# EAGLE design adapter (EAGLE 9.6.2)
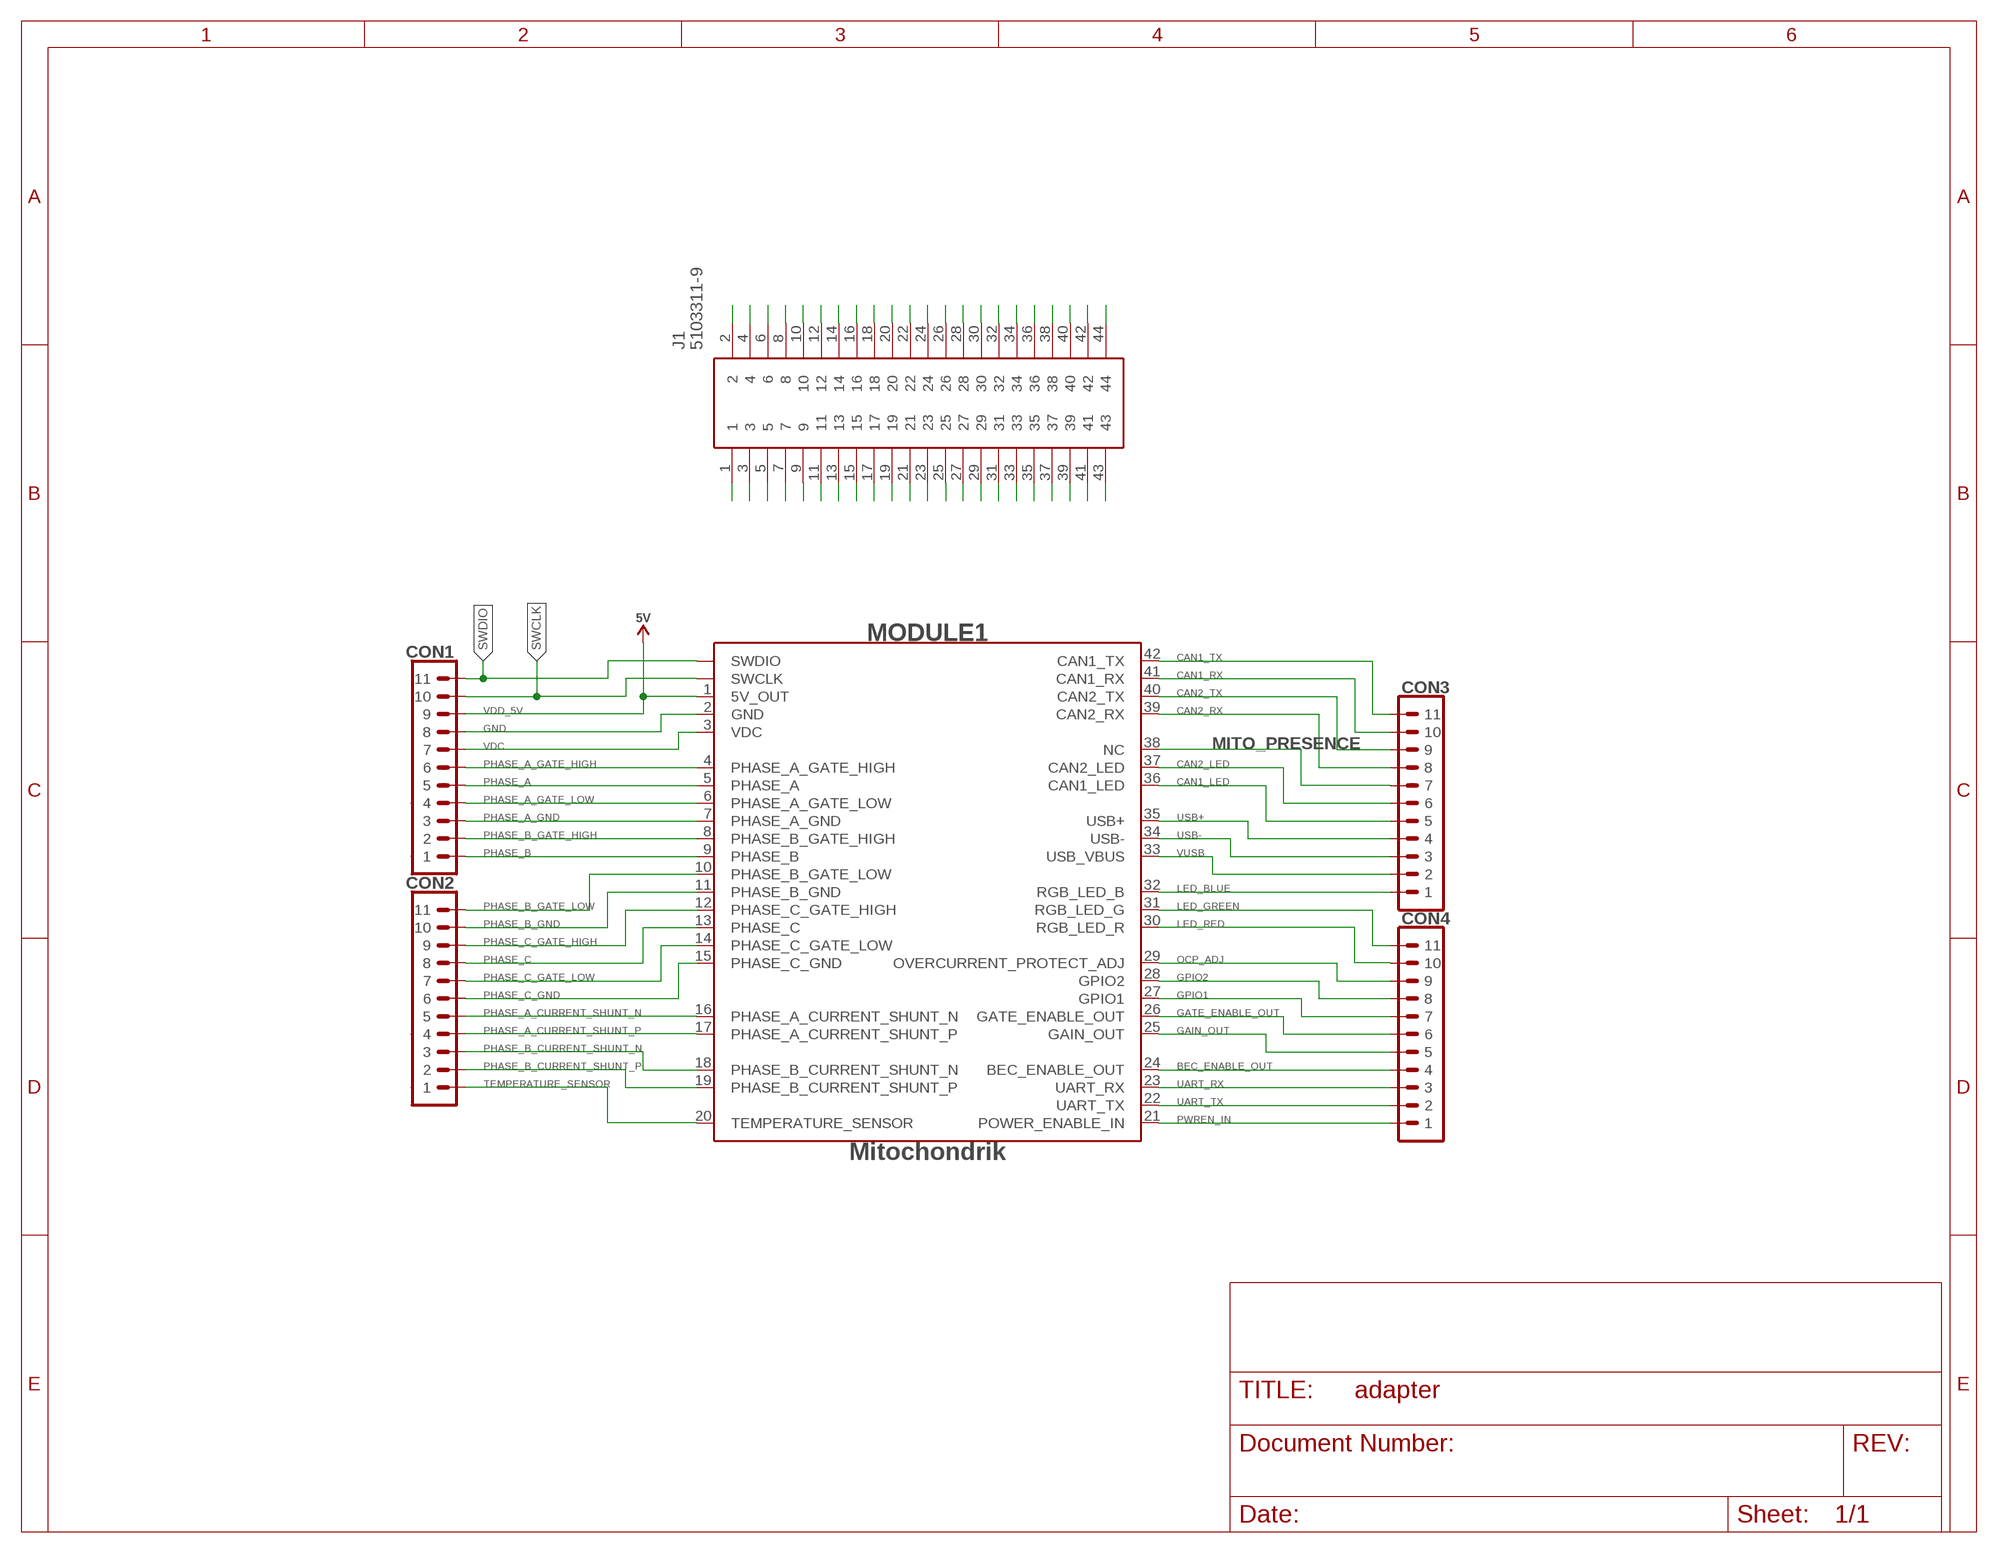
[diagram p0: schematic, sheet 1]

## Parts
CON1  PINHEAD_1X11-2.54_STRAIGHT_FEMALE  [1X11-PTH-2.54-FEMALE]
CON2  PINHEAD_1X11-2.54_STRAIGHT_FEMALE  [1X11-PTH-2.54-FEMALE]
CON3  PINHEAD_1X11-2.54_STRAIGHT_FEMALE  [1X11-PTH-2.54-FEMALE]
CON4  PINHEAD_1X11-2.54_STRAIGHT_FEMALE  [1X11-PTH-2.54-FEMALE]
J1  5103311-9  [SHDRRA44W66P254_2X22_6337X986X]
MODULE1  MITOHONDRIQUE_POGO-POGO  [MITOHONDRIQUE-POGO]

## Nets
BEC_ENABLE_OUT: CON4.4 J1.37 MODULE1.24(BEC_ENABLE_OUT)
CAN1_LED: CON3.5 J1.13 MODULE1.36(CAN1_LED)
CAN1_RX: CON3.10 J1.3 MODULE1.41(CAN1_RX)
CAN1_TX: CON3.11 J1.1 MODULE1.42(CAN1_TX)
CAN2_LED: CON3.6 J1.11 MODULE1.37(CAN2_LED)
CAN2_RX: CON3.8 J1.7 MODULE1.39(CAN2_RX)
CAN2_TX: CON3.9 J1.5 MODULE1.40(CAN2_TX)
GAIN_OUT: CON4.5 J1.35 MODULE1.25(GAIN_OUT)
GATE_ENABLE_OUT: CON4.6 J1.33 MODULE1.26(GATE_ENABLE_OUT)
GND: CON1.8 J1.8 MODULE1.2(GND)
GPIO1: CON4.7 J1.31 MODULE1.27(GPIO1)
GPIO2: CON4.8 J1.29 MODULE1.28(GPIO2)
LED_BLUE: CON3.1 J1.21 MODULE1.32(RGB_LED_B)
LED_GREEN: CON4.11 J1.23 MODULE1.31(RGB_LED_G)
LED_RED: CON4.10 J1.25 MODULE1.30(RGB_LED_R)
MITO_PRESENCE: CON3.7 J1.9 MODULE1.38(NC)
OCP_ADJ: CON4.9 J1.27 MODULE1.29(OVERCURRENT_PROTECT_ADJ)
PHASE_A: CON1.5 J1.14 MODULE1.5(PHASE_A)
PHASE_A_CURRENT_SHUNT_N: CON2.5 J1.36 MODULE1.16(PHASE_A_CURRENT_SHUNT_N)
PHASE_A_CURRENT_SHUNT_P: CON2.4 J1.38 MODULE1.17(PHASE_A_CURRENT_SHUNT_P)
PHASE_A_GATE_HIGH: CON1.6 J1.12 MODULE1.4(PHASE_A_GATE_HIGH)
PHASE_A_GATE_LOW: CON1.4 J1.16 MODULE1.6(PHASE_A_GATE_LOW)
PHASE_A_GND: CON1.3 J1.18 MODULE1.7(PHASE_A_GND)
PHASE_B: CON1.1 J1.22 MODULE1.9(PHASE_B)
PHASE_B_CURRENT_SHUNT_N: CON2.3 J1.40 MODULE1.18(PHASE_B_CURRENT_SHUNT_N)
PHASE_B_CURRENT_SHUNT_P: CON2.2 J1.42 MODULE1.19(PHASE_B_CURRENT_SHUNT_P)
PHASE_B_GATE_HIGH: CON1.2 J1.20 MODULE1.8(PHASE_B_GATE_HIGH)
PHASE_B_GATE_LOW: CON2.11 J1.24 MODULE1.10(PHASE_B_GATE_LOW)
PHASE_B_GND: CON2.10 J1.26 MODULE1.11(PHASE_B_GND)
PHASE_C: CON2.8 J1.30 MODULE1.13(PHASE_C)
PHASE_C_GATE_HIGH: CON2.9 J1.28 MODULE1.12(PHASE_C_GATE_HIGH)
PHASE_C_GATE_LOW: CON2.7 J1.32 MODULE1.14(PHASE_C_GATE_LOW)
PHASE_C_GND: CON2.6 J1.34 MODULE1.15(PHASE_C_GND)
PWREN_IN: CON4.1 J1.43 MODULE1.21(POWER_ENABLE_IN)
SWCLK: CON1.10 J1.4 MODULE1.SWCLK
SWDIO: CON1.11 J1.2 MODULE1.SWDIO
TEMPERATURE_SENSOR: CON2.1 J1.44 MODULE1.20(TEMPERATURE_SENSOR)
UART_RX: CON4.3 J1.39 MODULE1.23(UART_RX)
UART_TX: CON4.2 J1.41 MODULE1.22(UART_TX)
USB+: CON3.4 J1.15 MODULE1.35(USB+)
USB-: CON3.3 J1.17 MODULE1.34(USB-)
VDC: CON1.7 J1.10 MODULE1.3(VDC)
VDD_5V: CON1.9 J1.6 MODULE1.1(5V_OUT) ; supply symbol labelled 5V
VUSB: CON3.2 J1.19 MODULE1.33(USB_VBUS)

## Library data of the parts
CON1-CON4 = pinhead:PINHEAD_1X11; DIGIKEY#: S7009-ND; MANF: Sullins Connector Solutions; MANF#: PPTC111LFBN-RC
J1 = 5103311-9:5103311-9: A/L LOW PRO HDR 44P RA BLACK Source: Datasheet <https://componentsearchengine.com/Datasheets/1/5103311-9.pdf>; ALTERNATIVE: 1-5102153-3 for top; DESCRIPTION: A/L LOW PRO HDR 44P RA BLACK; HEIGHT: 9.271mm; MANF: TE Connectivity; MANF#: 5103311-9; MOUSER_PART_NUMBER: 571-5103311-9; MOUSER_PRICE-STOCK: https://www.mouser.com/Search/Refine.aspx?Keyword=571-5103311-9
MODULE1 = mito-pogo:MITOHONDRIQUE_POGO; MANF: Zubax Robotics; MANF#: Mitochondrik

## Net classes
1 VDC: width 0.3 mm, clearance 0.3 mm
2 5V: width 0.5 mm

## Board
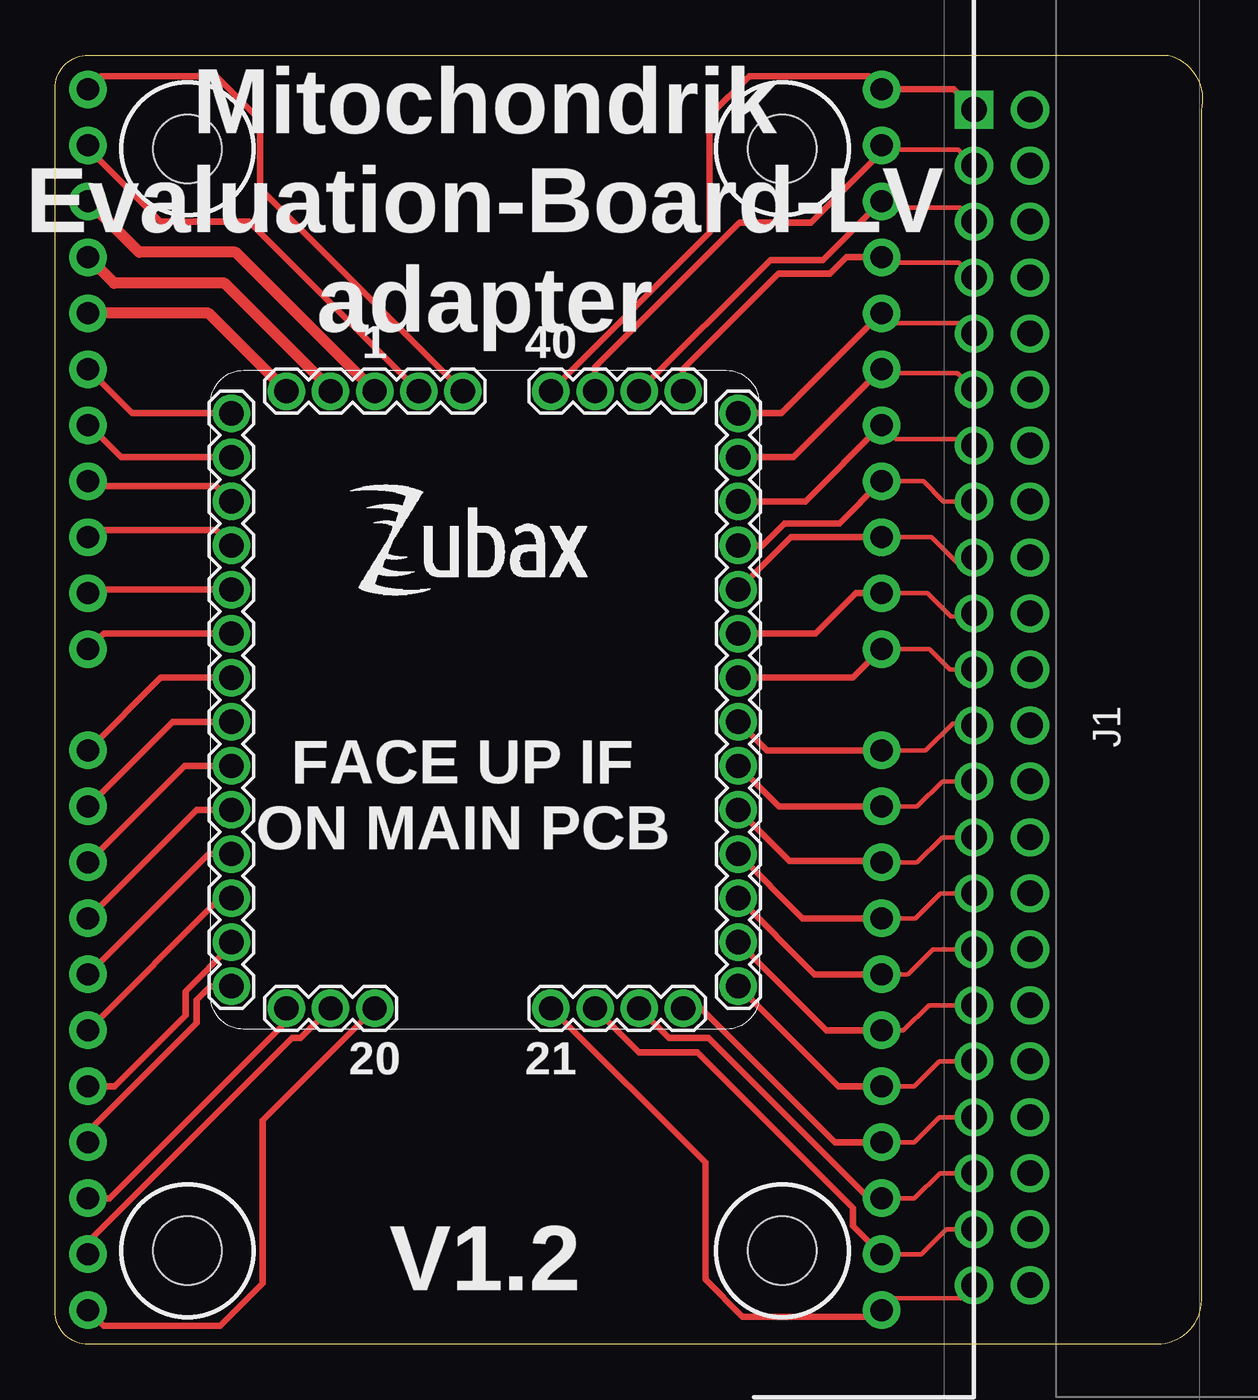
[diagram p1: board, top side]
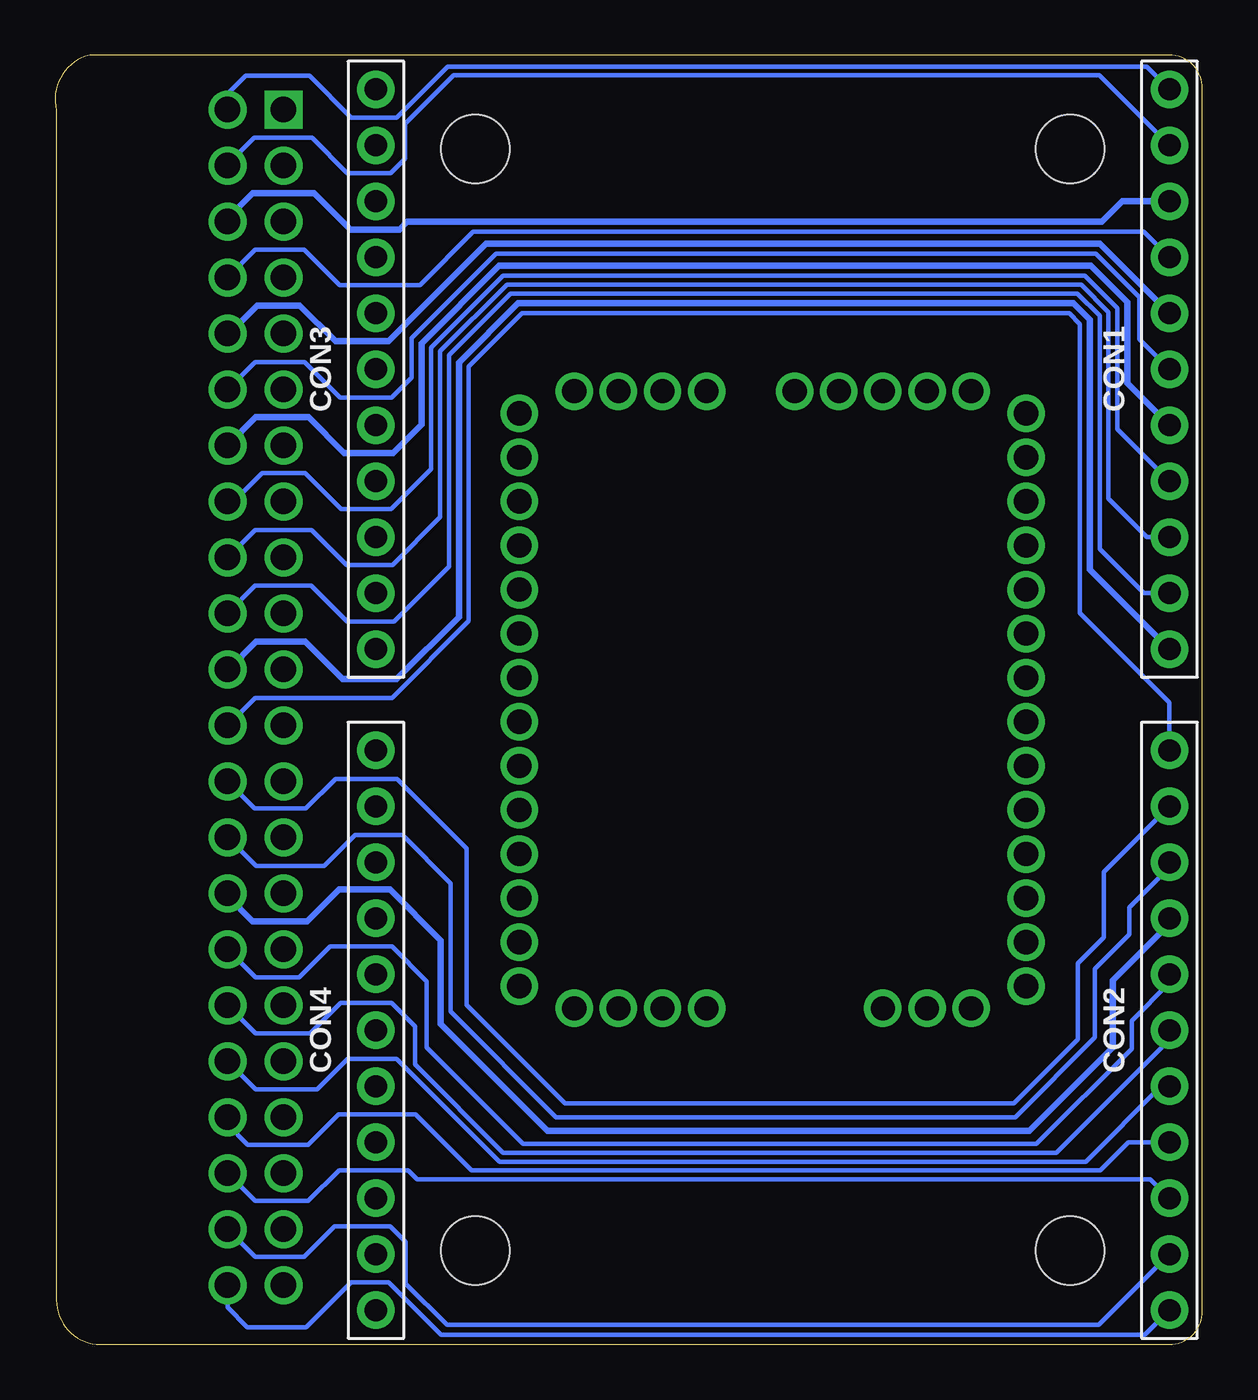
[diagram p2: board, bottom side, seen from below]

Size 52.06 x 58.5 mm. Coordinates in mm from the lower left corner, seen from the top.
Outline: 1.5,58.5 50.5,58.5 arc-90 52,56 52,2 arc-90 50,0 1.5,0 arc-90 0,1.5 0,57 arc-90 1.5,58.5
Copper layers (1*16): Top 0.035mm / dielectric 1.5mm / Bottom 0.035mm
Design rules "myxa *": minimum track width 0.15mm, minimum drill 0.2mm, track to track 0.2mm, track to pad 0.2mm, pad to pad 0.2mm, via to via 0.2mm, smd to smd 0.15mm, copper to edge 0.3mm, drill to drill 0.2mm, minimum pad ring 0.125mm, minimum via ring 0.125mm, stop-mask expansion 1mil, vias tented up to drill 0.51mm, thermal gap 8mil
Holes 3.1 mm at 6,4.25 33,4.25 6,54.25 33,54.25

### Footprints (pad centres in the part's own frame; a part is rotated, then mirrored left to right if it is on the bottom)
1X11-PTH-2.54-FEMALE = drill 1.016 pad 1.7: 1 -12.7,0; 2 -10.16,0; 3 -7.62,0; 4 -5.08,0; 5 -2.54,0; 6 0,0; 7 2.54,0; 8 5.08,0; 9 7.62,0; 10 10.16,0; 11 12.7,0
SHDRRA44W66P254_2X22_6337X986X = drill 1.15 pad 1.725 square: 1 0,0 | drill 1.15 pad 1.725: 2 0,2.54; 3 2.54,0; 4 2.54,2.54; 5 5.08,0; 6 5.08,2.54; 7 7.62,0; 8 7.62,2.54; 9 10.16,0; 10 10.16,2.54; 11 12.7,0; 12 12.7,2.54; 13 15.24,0; 14 15.24,2.54; 15 17.78,0; 16 17.78,2.54; 17 20.32,0; 18 20.32,2.54; 19 22.86,0; 20 22.86,2.54; 21 25.4,0; 22 25.4,2.54; 23 27.94,0; 24 27.94,2.54; 25 30.48,0; 26 30.48,2.54; 27 33.02,0; 28 33.02,2.54; 29 35.56,0; 30 35.56,2.54; 31 38.1,0; 32 38.1,2.54; 33 40.64,0; 34 40.64,2.54; 35 43.18,0; 36 43.18,2.54; 37 45.72,0; 38 45.72,2.54; 39 48.26,0; 40 48.26,2.54; 41 50.8,0; 42 50.8,2.54; 43 53.34,0; 44 53.34,2.54
MITOHONDRIQUE-POGO = drill 1.1 pad 1.7: 1 -5,14; 2 -7,14; 3 -9,14; 4 -11.5,13; 5 -11.5,11; 6 -11.5,9; 7 -11.5,7; 8 -11.5,5; 9 -11.5,3; 10 -11.5,1; 11 -11.5,-1; 12 -11.5,-3; 13 -11.5,-5; 14 -11.5,-7; 15 -11.5,-9; 16 -11.5,-11; 17 -11.5,-13; 18 -9,-14; 19 -7,-14; 20 -5,-14; 21 3,-14; 22 5,-14; 23 7,-14; 24 9,-14; 25 11.5,-13; 26 11.5,-11; 27 11.5,-9; 28 11.5,-7; 29 11.5,-5; 30 11.5,-3; 31 11.5,-1; 32 11.5,1; 33 11.5,3; 34 11.5,5; 35 11.5,7; 36 11.5,9; 37 11.5,11; 38 11.5,13; 39 9,14; 40 7,14; 41 5,14; 42 3,14; SWCLK -3,14; SWDIO -1,14

### Placement (x,y rotation side)
CON1  1.5,44.25 90 bottom
CON2  1.5,14.25 90 bottom
CON3  37.5,44.25 90 bottom
CON4  37.5,14.25 90 bottom
J1  41.7,56.03 270 top
MODULE1  19.5,29.25 0 top
U$2  [ZUBAX_LOGO_5X10]  13.3,33.8 0 top

### Tracks (layer width: path | path; a pad name or v marks a point on that pad's centre or on a via)
BEC_ENABLE_OUT
  Top 0.2: CON4.4 38.99,9.17 40.13,10.31 J1.37
  Top 0.3: CON4.4 35.38,9.17 29.3,15.25 MODULE1.24
CAN1_LED
  Top 0.2: CON3.5 38.14,41.07 41.42,41.07 J1.13
  Top 0.3: MODULE1.36 34.04,38.25 CON3.5
CAN1_RX
  Top 0.2: CON3.10 37.71,54.2 40.99,54.2 J1.3
  Top 0.3: MODULE1.41 24.5,44.35 31.05,50.9 34.3,50.9 37.5,54.1 CON3.10
CAN1_TX
  Top 0.3: CON3.11 36.9,57.55 31.5,57.55 29.7,55.75 29.7,50.45 MODULE1.42
  Top 0.305: CON3.11 40.78,56.95 J1.1
CAN2_LED
  Top 0.2: CON3.6 37.67,44.08 40.95,44.08 J1.11
  Top 0.3: MODULE1.37 33.5,40.25 CON3.6
CAN2_RX
  Top 0.2: CON3.8 37.74,49.09 41.02,49.09 J1.7
  Top 0.3: CON3.8 35.9,49.33 35.15,48.58 32.83,48.58 28.5,44.25 MODULE1.39
CAN2_TX
  Top 0.2: CON3.9 37.79,51.58 41.07,51.58 J1.5
  Top 0.3: CON3.9 34.83,49.2 32.45,49.2 MODULE1.40
GAIN_OUT
  Top 0.2: CON4.5 38.98,11.71 40.12,12.85 J1.35
  Top 0.3: MODULE1.25 35.54,11.71 CON4.5
GATE_ENABLE_OUT
  Top 0.2: CON4.6 38.5,14.25 39.64,15.39 J1.33
  Top 0.3: CON4.6 35,14.25 MODULE1.26
GND
  Top 0.5: MODULE1.2 12.5,43.35 7.7,48.15 2.68,48.15 CON1.8
  Bottom 0.2: CON1.8 2.66,50.49 33.09,50.49 35.51,48.07 39.15,48.07 40.75,49.67 42.98,49.67 J1.8
GPIO1
  Top 0.2: CON4.7 38.7,16.79 39.84,17.93 J1.31
  Top 0.3: CON4.7 34.46,16.79 MODULE1.27
GPIO2
  Top 0.2: CON4.8 39.03,19.33 40.17,20.47 J1.29
  Top 0.3: CON4.8 33.92,19.33 MODULE1.28
LED_BLUE
  Top 0.2: CON3.1 39.68,31.55 40.6,30.63 J1.21
  Top 0.3: CON3.1 36.2,30.25 MODULE1.32
LED_GREEN
  Top 0.2: CON4.11 39.5,26.95 40.73,28.18 41.61,28.18 J1.23
  Top 0.3: MODULE1.31 32.3,26.95 CON4.11
LED_RED
  Top 0.2: CON4.10 39.11,24.41 40.25,25.55 J1.25
  Top 0.3: MODULE1.30 32.84,24.41 CON4.10
MITO_PRESENCE
  Top 0.2: CON3.7 37.96,46.33 41.24,46.33 J1.9
  Top 0.3: CON3.7 32.96,42.25 MODULE1.38
OCP_ADJ
  Top 0.2: CON4.9 39.11,21.87 40.25,23.01 J1.27
  Top 0.3: MODULE1.29 33.33,21.93 37.45,21.93 CON4.9
PHASE_A
  Top 0.3: MODULE1.5 3,40.25 1.54,41.71 CON1.5
  Bottom 0.3: CON1.5 3.41,43.62 3.41,47.29 5.06,48.94 31.91,48.94 35.44,45.41 35.44,41.74 36.73,40.45 38.94,40.45 40.56,42.07 42.96,42.07 J1.14
PHASE_A_CURRENT_SHUNT_N
  Top 0.3: MODULE1.16 8,18.1 5.93,16.02 5.93,14.92 2.71,11.71 CON2.5
  Bottom 0.2: CON2.5 1.88,11.71 5.3,8.29 31.89,8.29 36.56,12.96 38.78,12.96 40.17,11.57 42.96,11.57 J1.36
PHASE_A_CURRENT_SHUNT_P
  Top 0.3: MODULE1.17 7.05,16.25 6.43,15.63 6.43,14.6 1.5,9.67 CON2.4
  Bottom 0.2: CON2.4 3.36,9.17 4.64,7.89 33.16,7.89 35.71,10.44 39.19,10.44 40.58,9.05 43.31,9.05 44.24,9.98 J1.38
PHASE_A_GATE_HIGH
  Top 0.3: MODULE1.4 3.5,42.25 CON1.6
  Bottom 0.2: CON1.6 2.86,45.61 2.86,47.51 4.83,49.49 32.06,49.49 35.89,45.65 35.89,43.87 36.79,42.97 39.13,42.97 40.74,44.58 42.99,44.58 J1.12
PHASE_A_GATE_LOW
  Top 0.3: MODULE1.6 7.3,38.95 1.72,38.95 CON1.4
  Bottom 0.2: CON1.4 3.86,41.53 3.86,47.01 5.34,48.49 31.73,48.49 34.99,45.22 34.99,39.72 36.81,37.9 39.08,37.9 40.72,39.54 42.67,39.54 43.96,38.25 J1.16
PHASE_A_GND
  Top 0.3: MODULE1.7 7.3,36.95 1.82,36.95 CON1.3
  Bottom 0.2: CON1.3 2.52,36.63 4.26,38.37 4.26,46.84 5.51,48.09 31.56,48.09 34.59,45.06 34.59,37.53 36.75,35.37 38.84,35.37 40.43,36.96 42.99,36.96 J1.18
PHASE_B
  Top 0.3: CON1.1 2.2,32.25 MODULE1.9
  Bottom 0.3: CON1.1 5.11,35.16 5.11,46.49 5.86,47.24 31.05,47.24 33.74,44.55 33.74,33 36.56,30.18 39.01,30.18 40.71,31.88 42.94,31.88 44.19,30.63 J1.22
PHASE_B_CURRENT_SHUNT_N
  Top 0.3: MODULE1.18 10.5,14.65 2.48,6.63 CON2.3
  Bottom 0.2: CON2.3 2.36,7.49 35.64,7.49 36.05,7.9 39.18,7.9 40.57,6.51 42.98,6.51 J1.40
PHASE_B_CURRENT_SHUNT_P
  Top 0.3: MODULE1.19 11.15,13.9 10.75,13.9 1.5,4.65 CON2.2
  Bottom 0.2: CON2.2 4.71,0.88 34.28,0.88 36.16,2.76 36.16,4.65 36.87,5.36 39.38,5.36 40.76,3.98 42.99,3.98 J1.42
PHASE_B_GATE_HIGH
  Top 0.3: MODULE1.8 1.66,34.25 CON1.2
  Bottom 0.2: CON1.2 2.65,34.09 4.66,36.1 4.66,46.68 5.67,47.69 31.39,47.69 34.19,44.89 34.19,35.29 36.67,32.81 38.82,32.81 40.44,34.43 42.98,34.43 J1.20
PHASE_B_GATE_LOW
  Top 0.3: MODULE1.10 4.8,30.25 CON2.11
  Bottom 0.2: CON2.11 1.5,29.12 5.56,33.18 5.56,46.3 6.04,46.79 30.87,46.79 33.29,44.36 33.29,32.81 36.76,29.34 42.99,29.34 J1.24
PHASE_B_GND
  Top 0.3: MODULE1.11 5.34,28.25 CON2.10
  Bottom 0.2: CON2.10 4.47,21.44 4.47,18.47 5.65,17.29 5.65,13.84 8.55,10.94 28.92,10.94 33.39,15.41 33.39,22.51 36.54,25.66 39.33,25.66 40.68,24.31 43,24.31 J1.26
PHASE_C
  Top 0.3: MODULE1.13 6.42,24.25 CON2.8
  Bottom 0.3: CON2.8 1.5,19.08 4.07,16.51 4.07,13.48 7.86,9.69 29.71,9.69 34.57,14.55 34.57,18.34 36.87,20.64 39.18,20.64 40.62,19.2 43.1,19.2 44.24,20.34 J1.30
PHASE_C_GATE_HIGH
  Top 0.3: MODULE1.12 5.88,26.25 CON2.9
  Bottom 0.2: J1.28 42.94,21.71 39.85,21.71 38.45,23.11 36.3,23.11 34.12,20.93 34.12,15.11 29.32,10.31 8.49,10.31 4.88,13.92 4.88,17.03 3.31,18.6 3.31,19.83 1.5,21.64 CON2.9
PHASE_C_GATE_LOW
  Top 0.3: MODULE1.14 6.96,22.25 CON2.7
  Bottom 0.2: J1.32 42.96,16.65 40.98,16.65 39.58,18.05 36.78,18.05 35.2,16.47 35.2,13.47 30.82,9.09 7.54,9.09 3.21,13.42 3.21,14.69 1.5,16.4 CON2.7
PHASE_C_GND
  Top 0.3: MODULE1.15 7.5,20.25 CON2.6
  Bottom 0.2: J1.34 42.97,14.12 40.49,14.12 39.11,15.5 36.8,15.5 35.73,14.43 35.73,12.7 31.72,8.69 6.63,8.69 1.5,13.82 CON2.6
PWREN_IN
  Top 0.2: CON4.1 38.04,2.09 41.1,2.09 J1.43
  Top 0.3: MODULE1.21 29.5,8.25 29.5,2.95 31.2,1.25 37.2,1.25 CON4.1
SWCLK
  Top 0.3: MODULE1.SWCLK 8.8,50.95 4.8,50.95 1.5,54.25 CON1.10
  Bottom 0.2: CON1.10 4.67,57.58 33.99,57.58 36.18,55.39 36.18,53.8 36.84,53.14 38.81,53.14 40.41,54.74 43.04,54.74 44.24,53.54 J1.4
SWDIO
  Top 0.3: CON1.11 2.1,57.55 7.3,57.55 9.3,55.55 9.3,52.45 MODULE1.SWDIO
  Bottom 0.2: CON1.11 2.53,57.98 34.25,57.98 36.56,55.67 38.62,55.67 40.52,57.57 43.42,57.57 44.24,56.75 J1.2
TEMPERATURE_SENSOR
  Top 0.3: MODULE1.20 9.43,10.18 9.43,2.77 7.5,0.85 2.2,0.85 CON2.1
  Bottom 0.2: CON2.1 2.62,0.43 34.54,0.43 36.93,2.82 38.64,2.82 40.68,0.78 43.34,0.78 44.24,1.68 J1.44
UART_RX
  Top 0.2: CON4.3 39,6.63 40.14,7.77 J1.39
  Top 0.3: MODULE1.23 27.85,13.9 29.65,13.9 36.92,6.63 CON4.3
UART_TX
  Top 0.2: CON4.2 39.3,4.09 40.44,5.23 J1.41
  Top 0.3: MODULE1.22 26.5,13.25 29.14,13.25 36.2,6.19 36.2,5.39 CON4.2
USB+
  Top 0.2: CON3.4 39.39,39.17 40.31,38.25 J1.15
  Top 0.3: MODULE1.35 32.1,36.25 33.1,37.25 35.58,37.25 CON3.4
USB-
  Top 0.2: CON3.3 39.77,36.63 40.92,35.48 41.47,35.48 J1.17
  Top 0.3: MODULE1.34 33.38,36.63 CON3.3
VDC
  Top 0.5: MODULE1.3 6.96,46.79 CON1.7
  Bottom 0.3: CON1.7 4.65,49.94 32.51,49.94 36.93,45.52 39.34,45.52 40.96,47.14 42.9,47.14 44.17,45.87 J1.10
VDD_5V
  Top 0.5: MODULE1.1 8.2,49.55 3.82,49.55 CON1.9
  Bottom 0.305: CON1.9 3.63,51.87 4.56,50.94 36.08,50.94 36.43,50.59 38.66,50.59 40.3,52.23 43.11,52.23 44.24,51.09 J1.6
VUSB
  Top 0.2: CON3.2 39.57,34.09 40.64,33.02 41.55,33.02 J1.19
  Top 0.3: MODULE1.33 34.5,32.25 36.34,34.09 CON3.2

### Text on the board
tPlace: Mitochondrik / Evaluation-Board-LV / adapter | 1 | 40 | FACE UP IF / ON MAIN PCB | 20 | 21 | V1.2